# Altium schematic sheet Computador_Abordo.SchDoc
size A2; SheetNumber: 2; SheetTotal: 3
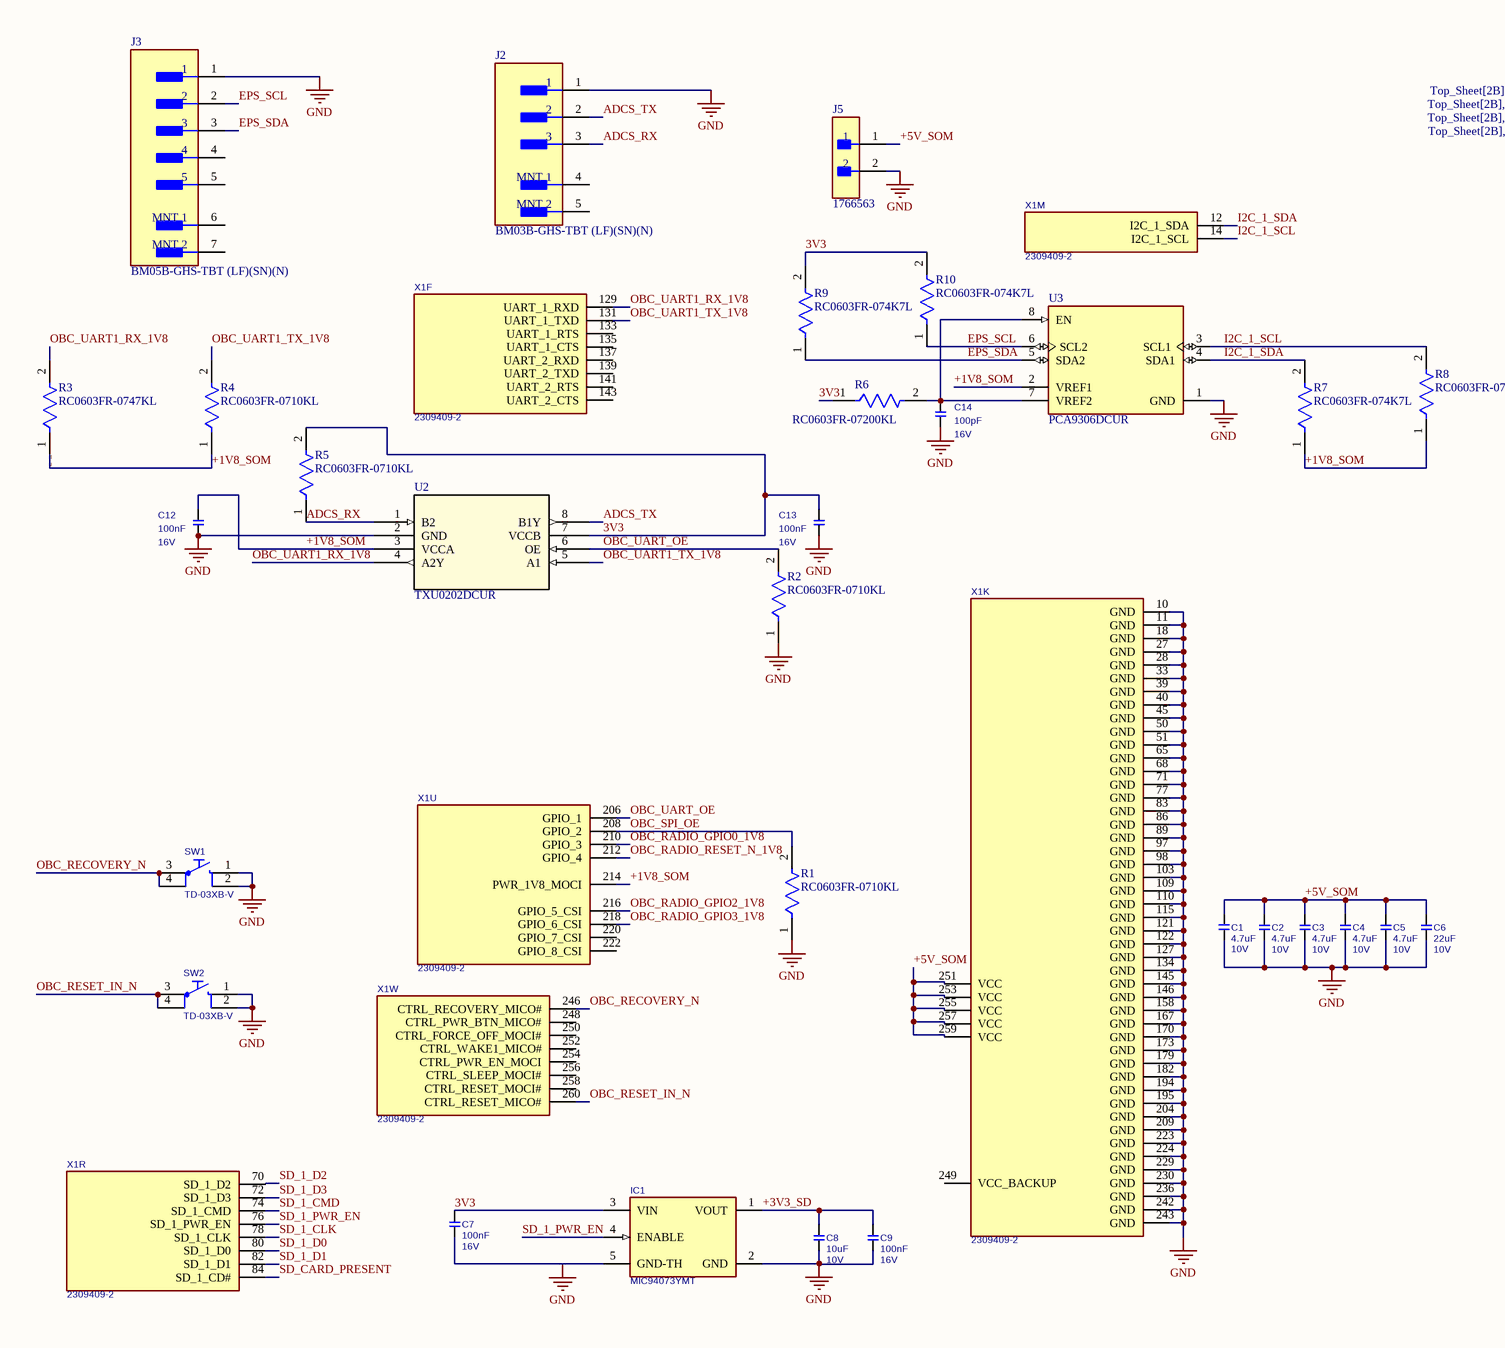
[diagram p0: Computador_Abordo.SchDoc, left]
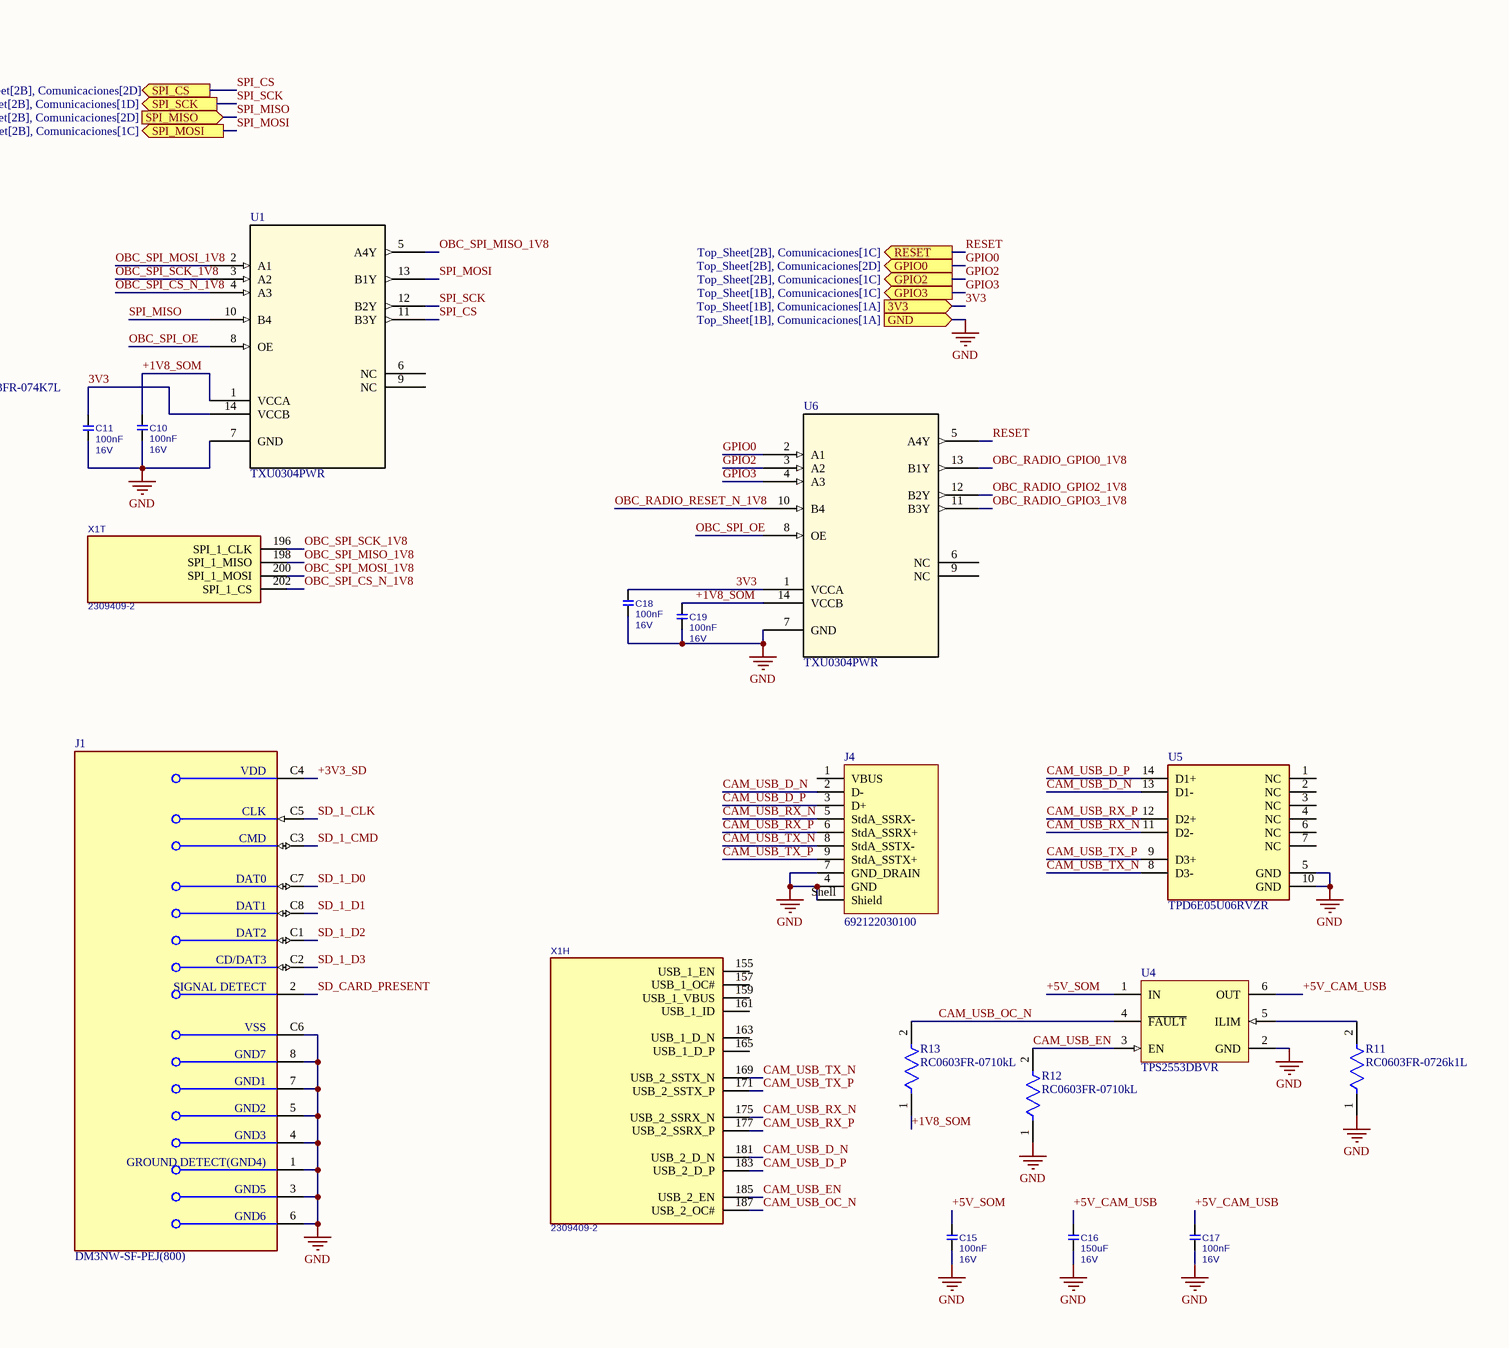
[diagram p1: Computador_Abordo.SchDoc, right]

## Parts
C1  Rating: 10V  [T_CAPC0603X33N]  (hidden comment: 4.7uF)
C2  Rating: 10V  [T_CAPC0603X33N]  (hidden comment: 4.7uF)
C3  Rating: 10V  [T_CAPC0603X33N]  (hidden comment: 4.7uF)
C4  Rating: 10V  [T_CAPC0603X33N]  (hidden comment: 4.7uF)
C5  Rating: 10V  [T_CAPC0603X33N]  (hidden comment: 4.7uF)
C6  Rating: 10V  [T_CAPC0805X125N]  (hidden comment: 22uF)
C7  Rating: 16V  [CAPC1005X60N]  (hidden comment: 100nF)
C8  Rating: 10V  [T_CAPC0603X33N]  (hidden comment: 10uF)
C9  Rating: 16V  [CAPC1005X60N]  (hidden comment: 100nF)
C10  Rating: 16V  [CAPC1005X60N]  (hidden comment: 100nF)
C11  Rating: 16V  [CAPC1005X60N]  (hidden comment: 100nF)
C12  Rating: 16V  [CAPC1005X60N]  (hidden comment: 100nF)
C13  Rating: 16V  [CAPC1005X60N]  (hidden comment: 100nF)
C14  Rating: 16V  [CAPC1005X60N]  (hidden comment: 100pF)
C15  Rating: 16V  [CAPC1005X60N]  (hidden comment: 100nF)
C16  Rating: 16V  [CAPC1005X60N]  (hidden comment: 150uF)
C17  Rating: 16V  [CAPC1005X60N]  (hidden comment: 100nF)
C18  Rating: 16V  [CAPC1005X60N]  (hidden comment: 100nF)
C19  Rating: 16V  [CAPC1005X60N]  (hidden comment: 100nF)
IC1  MIC94073YMT  [T_TDFN0P120X160X60-4N]
J1  DM3NW-SF-PEJ(800)  [FP-DM3NW-SF-PEJ_800-MFG]
J2  BM03B-GHS-TBT (LF)(SN)(N)  [FP-BM03B-GHS-TBT_LF_SN-MFG]
J3  BM05B-GHS-TBT (LF)(SN)(N)  [FP-BM05B-GHS-TBT_LF_SN-MFG]
J4  692122030100  [692122030100]
J5  1766563  [FP-1766563-MFG]
R1  RC0603FR-0710KL  [FP-RC0603-0_55-IPC_B]
R2  RC0603FR-0710KL  [FP-RC0603-0_55-IPC_B]
R3  RC0603FR-0747KL  [FP-RC0603-0_55-IPC_B]
R4  RC0603FR-0710KL  [FP-RC0603-0_55-IPC_B]
R5  RC0603FR-0710KL  [FP-RC0603-0_55-IPC_B]
R6  RC0603FR-07200KL  [FP-RC0603-0_55-IPC_B]
R7  RC0603FR-074K7L  [FP-RC0603-0_55-IPC_B]
R8  RC0603FR-074K7L  [FP-RC0603-0_55-IPC_B]
R9  RC0603FR-074K7L  [FP-RC0603-0_55-IPC_B]
R10  RC0603FR-074K7L  [FP-RC0603-0_55-IPC_B]
R11  RC0603FR-0726k1L  [FP-RC0603-0_55-IPC_B]
R12  RC0603FR-0710kL  [FP-RC0603-0_55-IPC_B]
R13  RC0603FR-0710kL  [FP-RC0603-0_55-IPC_B]
SW1  Manufacturer Part No.: TD-03XB-V  [T_WMF_TD-03XB]  (hidden comment: TD-03XB)
SW2  Manufacturer Part No.: TD-03XB-V  [T_WMF_TD-03XB]  (hidden comment: TD-03XB)
U1  TXU0304PWR  [TSSOP14_PW_TEX]
U2  TXU0202DCUR  [SO8_DCU_TEX]
U3  PCA9306DCUR  [FP-DCU0008A-MFG]
U4  TPS2553DBVR  [DBV0006A_N]
U5  TPD6E05U06RVZR  [FP-RVZ0014A-IPC_A]
U6  TXU0304PWR  [TSSOP14_PW_TEX]
X1  2309409-2  [CON-TE-2309409-2]  (parts F,H,K,M,R,T,U,W of 23)

## Ports
3V3 (in, see Top_Sheet[1B], Comunicaciones[1A]), GND (in, see Top_Sheet[1B], Comunicaciones[1A]), GPIO0 (out, see Top_Sheet[2B], Comunicaciones[2D]), GPIO2 (out, see Top_Sheet[2B], Comunicaciones[1C]), GPIO3 (out, see Top_Sheet[1B], Comunicaciones[1C]), RESET (out, see Top_Sheet[2B], Comunicaciones[1C]), SPI_CS (out, see Top_Sheet[2B], Comunicaciones[2D]), SPI_MISO (in, see Top_Sheet[2B], Comunicaciones[2D]), SPI_MOSI (out, see Top_Sheet[2B], Comunicaciones[1C]), SPI_SCK (out, see Top_Sheet[2B], Comunicaciones[1D])

## Nets
GND: C1.1 C2.1 C3.1 C4.1 C5.1 C6.1 C8.1 C9.1 C10.1 C11.1 C12.1 C13.1 C14.1 C15.1 C16.1 C17.1 C18.1 C19.1 IC1.2(GND) J1.1(GROUND_DETECT(GND4)) J1.3(GND5) J1.4(GND3) J1.5(GND2) J1.6(GND6) J1.7(GND1) J1.8(GND7) J1.C6(VSS) J2.1 J3.1 J4.4(GND) J4.7(GND_DRAIN) J4.Shell(Shield) J5.2 R1.1 R2.1 R11.1 R12.1 SW1.1 SW1.2 SW2.1 SW2.2 U1.7(GND) U2.2(GND) U3.1(GND) U4.2(GND) U5.5(GND) U5.10(GND) U6.7(GND) X1.10(GND) X1.11(GND) X1.18(GND) X1.27(GND) X1.28(GND) X1.33(GND) X1.39(GND) X1.40(GND) X1.45(GND) X1.50(GND) X1.51(GND) X1.65(GND) X1.68(GND) X1.71(GND) X1.77(GND) X1.83(GND) X1.86(GND) X1.89(GND) X1.97(GND) X1.98(GND) X1.103(GND) X1.109(GND) X1.110(GND) X1.115(GND) X1.121(GND) X1.122(GND) X1.127(GND) X1.134(GND) X1.145(GND) X1.146(GND) X1.158(GND) X1.167(GND) X1.170(GND) X1.173(GND) X1.179(GND) X1.182(GND) X1.194(GND) X1.195(GND) X1.204(GND) X1.209(GND) X1.223(GND) X1.224(GND) X1.229(GND) X1.230(GND) X1.236(GND) X1.242(GND) X1.243(GND) ; port GND
3V3: C7.2 C11.2 C13.2 C18.2 IC1.3(VIN) R5.2 R6.1 R9.2 R10.2 U1.14(VCCB) U2.7(VCCB) U6.1(VCCA) ; port 3V3
+1V8_SOM: C10.2 C12.2 C19.2 R3.1 R4.1 R7.1 R8.1 R13.1 U1.1(VCCA) U2.3(VCCA) U3.2(VREF1) U6.14(VCCB) X1.214(PWR_1V8_MOCI)  [also labelled |]
+3V3_SD: C8.2 C9.2 IC1.1(VOUT) J1.C4(VDD)
+5V_CAM_USB: C16.2 C17.2 U4.6(OUT)
+5V_SOM: C1.2 C2.2 C3.2 C4.2 C5.2 C6.2 C15.2 J5.1 U4.1(IN) X1.251(VCC) X1.253(VCC) X1.255(VCC) X1.257(VCC) X1.259(VCC)
ADCS_RX: J2.3 R5.1 U2.1(B2)
ADCS_TX: J2.2 U2.8(B1Y)
CAM_USB_D_N: J4.2(D-) U5.13(D1-) X1.181(USB_2_D_N)
CAM_USB_D_P: J4.3(D+) U5.14(D1+) X1.183(USB_2_D_P)
CAM_USB_EN: R12.2 U4.3(EN) X1.185(USB_2_EN)
CAM_USB_OC_N: R13.2 U4.4(~{FAULT}) X1.187(USB_2_OC#)
CAM_USB_RX_N: J4.5(StdA_SSRX-) U5.11(D2-) X1.175(USB_2_SSRX_N)
CAM_USB_RX_P: J4.6(StdA_SSRX+) U5.12(D2+) X1.177(USB_2_SSRX_P)
CAM_USB_TX_N: J4.8(StdA_SSTX-) U5.8(D3-) X1.169(USB_2_SSTX_N)
CAM_USB_TX_P: J4.9(StdA_SSTX+) U5.9(D3+) X1.171(USB_2_SSTX_P)
EPS_SCL: J3.2 R10.1 U3.6(SCL2)
EPS_SDA: J3.3 R9.1 U3.5(SDA2)
GPIO0: U6.2(A1) ; port GPIO0
GPIO2: U6.3(A2) ; port GPIO2
GPIO3: U6.4(A3) ; port GPIO3
I2C_1_SCL: R8.2 U3.3(SCL1) X1.14(I2C_1_SCL)
I2C_1_SDA: R7.2 U3.4(SDA1) X1.12(I2C_1_SDA)
OBC_RADIO_GPIO0_1V8: U6.13(B1Y) X1.210(GPIO_3)
OBC_RADIO_GPIO2_1V8: U6.12(B2Y) X1.216(GPIO_5_CSI)
OBC_RADIO_GPIO3_1V8: U6.11(B3Y) X1.218(GPIO_6_CSI)
OBC_RADIO_RESET_N_1V8: U6.10(B4) X1.212(GPIO_4)
OBC_RECOVERY_N: SW1.3 SW1.4 X1.246(CTRL_RECOVERY_MICO#)
OBC_RESET_IN_N: SW2.3 SW2.4 X1.260(CTRL_RESET_MICO#)
OBC_SPI_CS_N_1V8: U1.4(A3) X1.202(SPI_1_CS)
OBC_SPI_MISO_1V8: U1.5(A4Y) X1.198(SPI_1_MISO)
OBC_SPI_MOSI_1V8: U1.2(A1) X1.200(SPI_1_MOSI)
OBC_SPI_OE: R1.2 U1.8(OE) U6.8(OE) X1.208(GPIO_2)
OBC_SPI_SCK_1V8: U1.3(A2) X1.196(SPI_1_CLK)
OBC_UART1_RX_1V8: R3.2 U2.4(A2Y) X1.129(UART_1_RXD)
OBC_UART1_TX_1V8: R4.2 U2.5(A1) X1.131(UART_1_TXD)
OBC_UART_OE: R2.2 U2.6(OE) X1.206(GPIO_1)
RESET: U6.5(A4Y) ; port RESET
SD_1_CLK: J1.C5(CLK) X1.78(SD_1_CLK)
SD_1_CMD: J1.C3(CMD) X1.74(SD_1_CMD)
SD_1_D0: J1.C7(DAT0) X1.80(SD_1_D0)
SD_1_D1: J1.C8(DAT1) X1.82(SD_1_D1)
SD_1_D2: J1.C1(DAT2)
SD_1_D3: J1.C2(CD/DAT3) X1.72(SD_1_D3)
SD_1_PWR_EN: IC1.4(ENABLE) X1.76(SD_1_PWR_EN)
SD_CARD_PRESENT: J1.2(SIGNAL_DETECT) X1.84(SD_1_CD#)
SPI_CS: U1.11(B3Y) ; port SPI_CS
SPI_MISO: U1.10(B4) ; port SPI_MISO
SPI_MOSI: U1.13(B1Y) ; port SPI_MOSI
SPI_SCK: U1.12(B2Y) ; port SPI_SCK
NetC7_1: C7.1 IC1.5(GND-TH)
NetC14_2: C14.2 R6.2 U3.7(VREF2) U3.8(EN)
NetR11_2: R11.2 U4.5(ILIM)

Not connected (* = marked no-connect by the designer): J2 4(MNT_1) 5(MNT_2); J3 4 5 6(MNT_1) 7(MNT_2); J4 1(VBUS); U1 6(NC) 9(NC); U5 1(NC) 2(NC) 3(NC) 4(NC) 6(NC) 7(NC); U6 6(NC) 9(NC); X1 70(SD_1_D2) 133(UART_1_RTS) 135(UART_1_CTS) 137(UART_2_RXD) 139(UART_2_TXD) 141(UART_2_RTS) 143(UART_2_CTS) 155(USB_1_EN) 157(USB_1_OC#) 159(USB_1_VBUS) 161(USB_1_ID) 163(USB_1_D_N) 165(USB_1_D_P) 220(GPIO_7_CSI) 222(GPIO_8_CSI) 248(CTRL_PWR_BTN_MICO#) 249(VCC_BACKUP) 250(CTRL_FORCE_OFF_MOCI#) 252(CTRL_WAKE1_MICO#) 254(CTRL_PWR_EN_MOCI) 256(CTRL_SLEEP_MOCI#) 258(CTRL_RESET_MOCI#)

## Notes on the sheet
- Labels drawn without touching a wire or pin: GND

## Library data of the parts
C1-C5 = C-X5R-4.7uF-10V-10%-0603: Capacitor Ceramic X5R 4.7uF 10V 10% 0603; Tolerance: 10%; Type: X5R; Value: 4.7uF
C6 = C-X5R-22uF-10V-20%-0805: Capacitor Ceramic X5R 22uF 10V 20% 0805; Tolerance: 20%; Type: X5R; Value: 22uF
C7 C9-C19 = C-X7R-100nF-16V-10%-0402: Capacitor Ceramic X7R 100nF 16V 10% 0402; Tolerance: 10%; Type: X7R
  C7 C9-C13 C15 C17-C19: Value: 100nF
  C14: Value: 100pF
  C16: Value: 150uF
C8 = C-X5R-10uF-10V-20%-0603: Capacitor Ceramic X5R 10uF 10V 20% 0603; Tolerance: 20%; Type: X5R; Value: 10uF
IC1 = IC-Microchip-MIC94073YMT: High Side Load Switch, TDFN4 1.2 x 1.6; Manufacturer Name: Microchip; Package: TDFN-4; Manufacturer Part No.: MIC94073YMT
J1 = CMP-11597-000007-1: CONN MICROSD CARD PUSH-PUSH SMD; RoHS Compliant: Yes
J2 = CMP-17439-000616-1: CONN HEADER SMD 3POS 1.25MM; Mated Stacking Heights: 7.3mm; Voltage Rating: 50V; Pitch: 0.049inch; Number of Positions: 3; Contact Material: Bronze; Number of Rows: 1; Packaging: Cut Tape; Fastening Type: Ramp; Contact Shape: Rectangular; Termination: Solder; Flammability Rating: UL94 V-0; Lead Free: Lead Free; Color: Natural; Mount: Surface Mount; Contact Finish - Mating: TIN; Max Operating Temperature: 85°C; Series: GH; Insulation Color: Natural; Connector Type: Header; Insulation Material: Nylon; Contact Type: Outer Shroud Contact; Min Operating Temperature: -25°C; Contact Plating: Tin
J3 = CMP-17439-000467-1: CONN HEADER SMD 5POS 1.25MM; Pitch: 0.049inch; Number of Positions: 5; Mated Stacking Heights: 7.3mm; Voltage Rating: 50V; Contact Material: Bronze; Number of Pins: 5; Contact Type: Outer Shroud Contact; Lead Free: Lead Free; Insulation Material: Nylon; Flammability Rating: UL94 V-0; Min Operating Temperature: -25°C; Series: GH; Mount: Surface Mount; Number of Rows: 1; Color: Natural; Packaging: Cut Tape; Contact Shape: Rectangular; Contact Plating: Tin; Contact Finish - Mating: TIN; Connector Type: Header; Insulation Color: Natural; Fastening Type: Ramp; Termination: Solder; Max Operating Temperature: 85°C
J4 = CMP-1502-03220-3: Conn USB 3.0 Type A RCP 9 POS 1.25mm Solder RA SMD 9 Terminal 1 Port T/R; Current Rating: 250mA; Insulation Resistance: 100MΩ; Number of Contacts: 9; Number of Ports: 1; Voltage Rating (AC): 30V; USB Standard: USB 3.0; Gender: Receptacle; Contact Resistance: 50mΩ; RoHS: Compliant; Min Operating Temperature: -20°C; Packaging: Tape and Reel; Width: 16.66mm; Contact Plating: Gold; Color: Blue; Height: 8.01mm; Mount: Horizontal, Surface Mount, Through Hole; Voltage Rating: 30V; Contact Material: Gold, Nickel; Connector Type: USB; REACH SVHC: Unknown; Number of Pins: 9; Max Operating Temperature: 85°C; Operating Supply Voltage: 30V; Lead Free: Lead Free; Termination: SMD/SMT; Orientation: Horizontal; Flammability Rating: UL94 V-0; Features: Shielded; Length: 15.1mm
J5 = CMP-09399-000002-1: TERM BLOCK HDR 2POS VERT 7.62MM; Manufacturer: Phoenix Contact; Conn Gender: Male; Number Of Contacts: 2; Conn Orientation: Straight; Voltage Rating: 630V; Current Rating: 12A; Package: 1766563; Device Class L3: unset; Pitch: 7.62mm; Contact Material: Tin; Height: 12.15mm; Digikey Description: TERM BLOCK HDR 2POS VERT 7.62MM; RoHS: TRUE; Category: Conn; Octopart: https://octopart.com/1766563-phoenix+contact-859397; Lead Free: Yes; Number Of Rows: 1; Footprint Url: https://www.phoenixcontact.com/online/portal/us/pxc/product_detail_page/!ut/p/z1/3Vffc6IwEP5X7INvjVkCBLyZe8AftfaqtVVb4YUJIdrcCVhAbfvXX1B753hz-tBx5g4mA0l299vsJl9mwR6eYC9mKzljuUxiNldj16P-qDFqtweEanf3ZgO6LbPZvjUetOs-wY_Yw17OAuxqRW8ug5Slb9hdZiIuJhYyVCKLUpPqxTiZDprNb9gdIE1DQNR7AyDzucDulRAhyp_TZDl7rjwLFoq0giqd3nDUeKyQS7MKFYI6yLqkRM1_oD4dXaOjHBwPYWsPf3kcOGXvKnvLJx0NtGtD68GtZcE9uXIIaQ2cEWh4uElEOJ2zeLZkMxXoZiLJZJHl7SgVXMiVSHcyzn8c5ujP1KZJuOQFxEi85lvD3zuh_EVJ-OHrYBd2pi2RMznPurmIunsKJwLSSxZQB8oWEClbQGXjUKdsHLLLxiG7bByyy8ahu9IdubJdCnf0vwtIKSxTid3FK0cJR1KJw43mF4Xz9UPrBnsyiGprHtWgplRrO1B_q-svikifGtgdayKerVWF6R0tIh1tp3CkCB2K2B8P_cGkOR4ez3vrgeKnlRRrPI6TNFJV_HYXeJGJEGwQBliIhcREhkUEYlDnKIC6YQvDmBIw8TWc8mB-0sMJeOus8NZ54fvnTc6VcV74z67-5uhRvzWKf0r5_eXFc7DHkzgvCDwpiF2FtQiqEDGpujtGZVWYyyzfMEr1FzzwlU0seJ6kmb_4dUtUIeSmbTFqocA0ABmUUsQIGEgInQR0aml63caLKLL1oqHx5H0kgve9ZoO-E26b3--bq_32Dxr0kVfvok4zsHtt3ZxF_sEncy4ufgLJYhWE/p0/IZ7_2G101H41M0L770Q2FA22DPAT82=CZ6_TBTEEP261OQ5B0ID5CEL4R1HN2=LA0=EdownloadId!4187324=action!downloadFile==/#Z7_2G1; Device Class L1: Connectors; Automotive: No; ComponentLink2Description: Datasheet; ComponentLink2URL: https://www.phoenixcontact.com/pxc-oc-itemdetail-pdf-web/eshop?lineItemType=LineItem&UID=1766563; Device Class L2: Headers and Wire Housings; Manufacturer Part Number: 1766563; Mouser Description: Pluggable Terminal Blocks 2 Pos 7.62mm pitch Through Hole Header
R1-R13 = CMP-2100-03664-2: RES 10K OHM 1% 1/10W 0603; Voltage Rating: 75V; Voltage Rating (DC): 50V; Resistance: 10kR; Power Rating: 100mW; Temperature Coefficient: 100ppm/°C; Depth: 0.8mm; Termination: SMD/SMT; Resistor Type: Thick Film; Series: RC; Construction: Rectangular; Features: Moisture Resistant; Packaging: Tape and Reel; Min Operating Temperature: -55°C; Number of Terminations: 2; Lead Pitch: 0.3mm; RoHS Compliant: Yes; Case/Package: 0603; Resistance Tolerance: 1%; Military Standard: Not; Weight: 7.1E-05oz; Number of Pins: 2; Tolerance: 1%; Length: 1.6mm; Case Code (Imperial): 0603; Lead Free: Lead Free; Width: 0.8mm; Max Power Dissipation: 100mW; Height: 0.45mm; Max Operating Temperature: 155°C; Case Code (Metric): 1608; Size Code: 0603
SW1 SW2 = SW-WMF-TD-03XB: Push Button; Manufacturer Name: Wealth Metal; Rating: 50mA
U1 U6 = TXU0304PWR: Four-channel fixed multidirectional level shifter 14-TSSOP -40 to 125; Manufacturer_Name: Texas Instruments; Copyright: Copyright (C) 2026 Ultra Librarian. All rights reserved.; Manufacturer_Part_Number: TXU0304PWR; RefDes: RefDes; Type: Type
U2 = TXU0202DCUR: Two channel fixed-direction level shifter with channels in opposite direction 8-VSSOP -40 to 125; Manufacturer_Name: Texas Instruments; Copyright: Copyright (C) 2026 Ultra Librarian. All rights reserved.; Manufacturer_Part_Number: TXU0202DCUR; RefDes: RefDes; Type: Type
U3 = CMP-0314-00419-3: IC TRNSLTR BIDIRECTIONAL 8VSSOP; Output Type: I2C; Max Supply Voltage: 5V; Number of Outputs: 2; Min Supply Voltage: 0uV; Logic Function: Translator; Turn-On Delay Time: 1.2ns; Output Current: 64mA; Propagation Delay: 1.4ns; Height: 0.85mm; Case/Package: VSSOP; Min Operating Temperature: -40°C; Weight: 0.000339oz; Packaging: Tape and Reel; Number of Pins: 8; Package Quantity: 1; Contact Plating: Gold; Termination: SMD/SMT; Max Operating Temperature: 85°C; Radiation Hardening: No; Number of Bits: 2; REACH SVHC: No SVHC; Lead Free: Lead Free; Number of Channels: 2; Length: 2.3mm; Number of Inputs: 2; Width: 2mm
U4 = CMP-0337-00284-2: Adjustable, Active High, Constant-Current, Current-Limited Power-Distribution Switch, 0.075 to 1.7 A Current Limit, -40 to 85 degC, 6-pin SOT-23 (DBV), Green (RoHS & no Sb/Br); Manufacturer: Texas Instruments; Continuous Current(Max)(A): 1.5; Vin(Min)(V): 2.5; Current Limit Accuracy @ 1A: +/-7.5% (925mA min / 1075mA max); Vin(Max)(V): 6.5; Rating: Catalog; rDS(on) per FET(Typ)(mOhms): 100/DRV, 85/DBV; Number of Switches: 1; ComponentLink1Description: Datasheet; PartNumber: TPS2553DBVR; Enable: Active High; PackageDescription: 6-Pin Plastic Small-Outline Package, 2.9 x 1.6 mm Body, 0.95 mm Pitch, 2.8 mm Lead Span; DatasheetVersion: SLVS841E; Code_JEDEC: MO-178-AB*; Current Limit Topology: Constant-Current; Mounting Technology: Surface Mount; Eco-Plan: Green (RoHS & no Sb/Br); PackageVersion: revK, Mar-2006; PackageReference: DBV0006A; ComponentLink1URL: http://www.ti.com/general/docs/lit/getliterature.tsp?genericPartNumber=TPS2553&fileType=pdf; Current Limit(A): 0.075 to 1.7
U5 = CMP-04985-000017-1: TVS DIODE 5.5V 14V 14USON; Number of Channels: 6; Peak Pulse Current: 2.5A; Polarity: Bidirectional; Interface: LVDS; Leakage Current: 10nA; Direction: Unidirectional; Power Line Protection: Yes; Breakdown Voltage: 6V; Max Power Dissipation: 40W; Min Operating Temperature: -40°C; Working Voltage: 5.5V; Number of Pins: 14; Termination: SMD/SMT; Number of Bidirectional Channels: 6; Reverse Standoff Voltage: 5.5V; Package Quantity: 3000; Mount: Surface Mount; Max Operating Temperature: 125°C; Radiation Hardening: No; Length: 3.6mm; RoHS Compliant: Yes; Lead Free: Lead Free; Packaging: Tape and Reel; Min Breakdown Voltage: 6V; Clamping Voltage: 14V; Peak Pulse Power: 40W; Depth: 1.45mm
X1 = CON-TE-2309409-2: DDR4 SODIMM Socket, 260 pins, 5.2mm(H), 0.5mm Pitch; Manufacturer Name: TE Connectivity; Manufacturer Part No.: 2309409-2; Temperature Range: -40C to +125C; Package: DDR4-SODIMM-260